# EAGLE design breakout_pico (EAGLE 9.6.2)
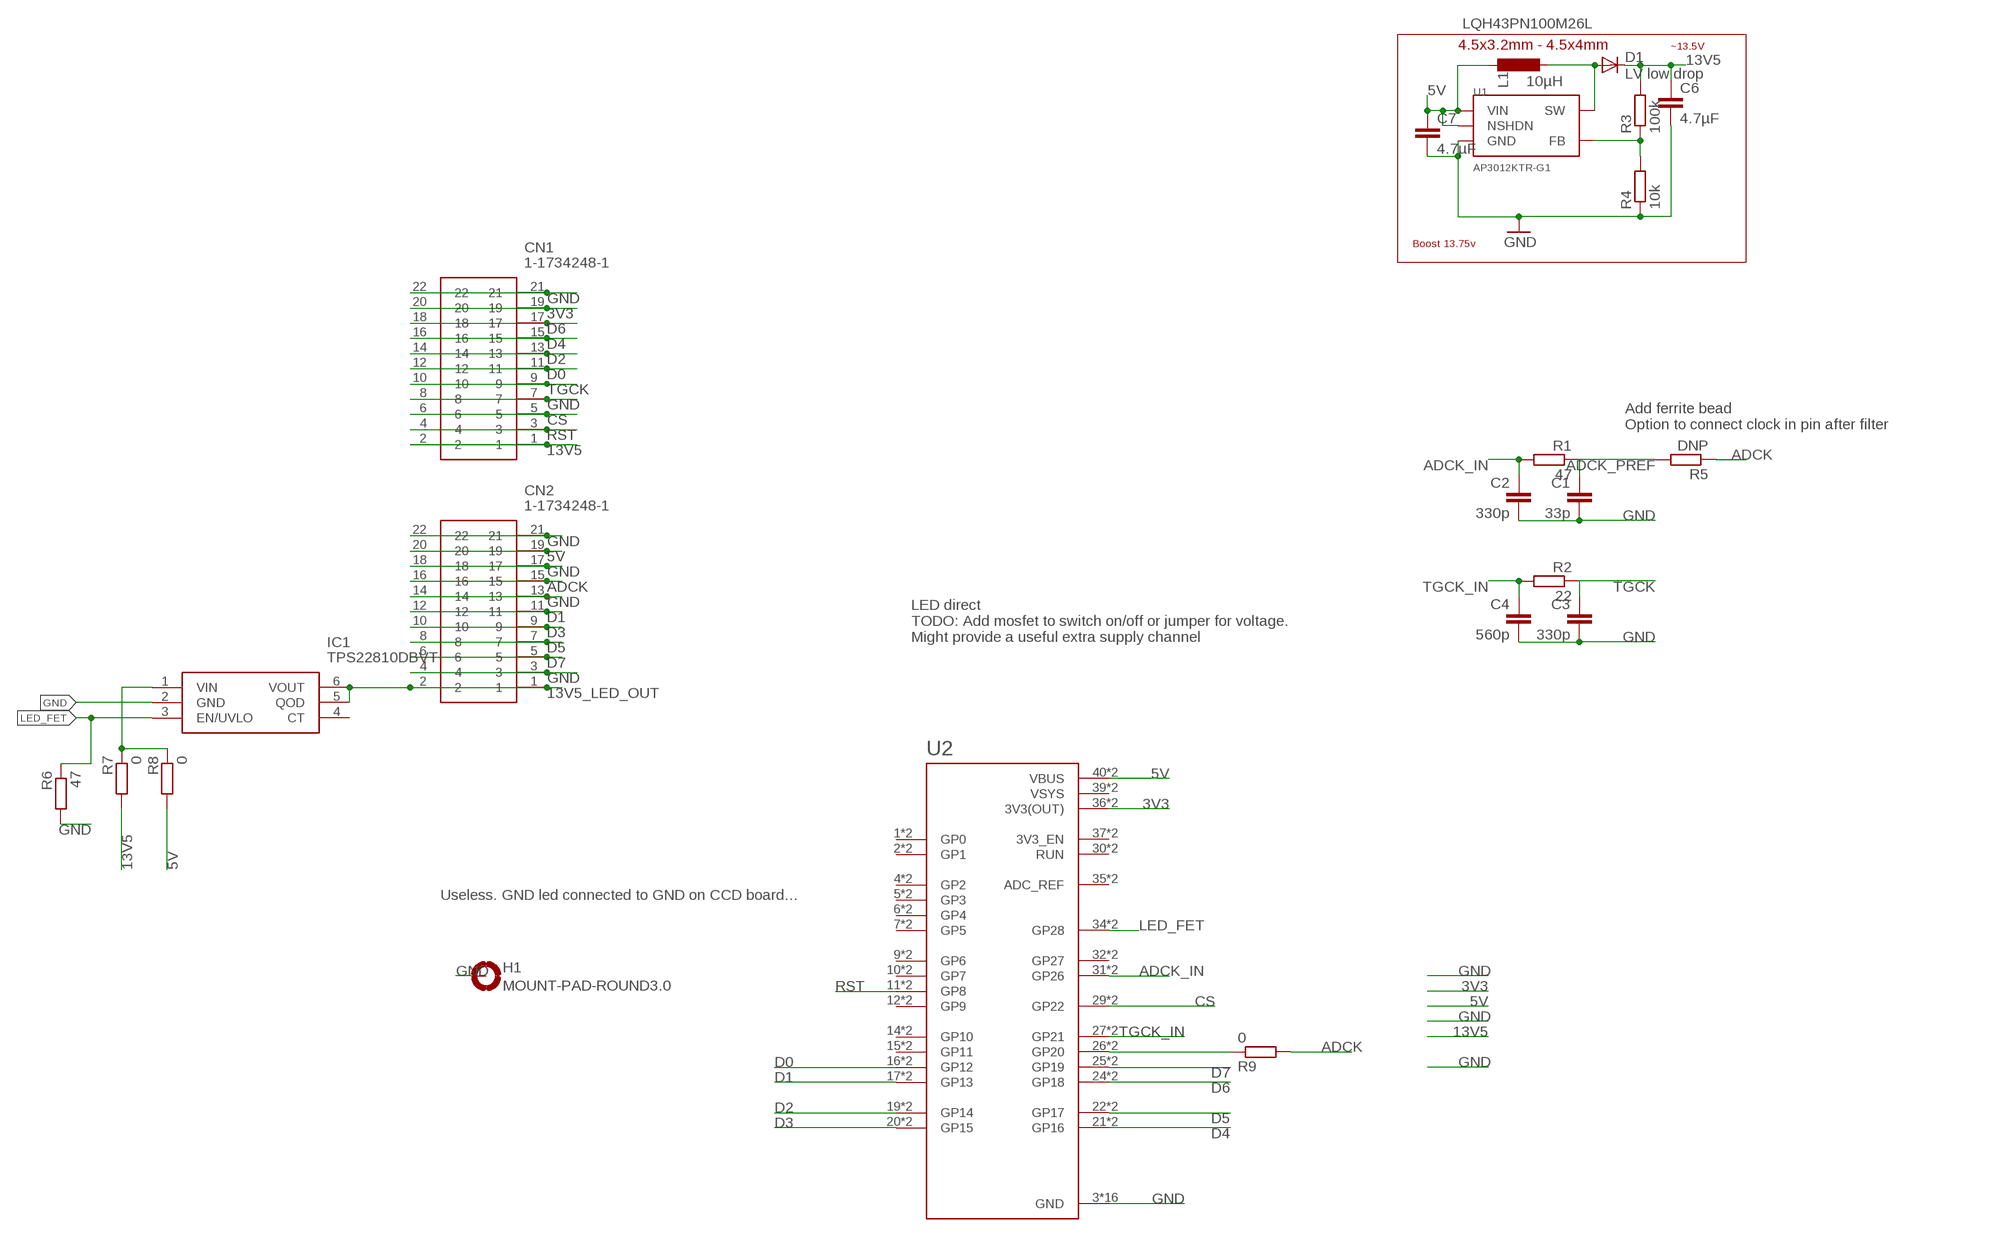
[diagram p0: schematic, sheet 1]

## Parts
C1  33p  C-EUC0603  [C0603]
C2  330p  C-EUC0603  [C0603]
C3  330p  C-EUC0603  [C0603]
C4  560p  C-EUC0603  [C0603]
C6  4.7µF  C-EUC0805  [C0805]
C7  4.7µF  C-EUC0805  [C0805]
CN1  1-1734248-1  [117342481]
CN2  1-1734248-1  [117342481]
D1  LV low drop  DIODE_SOD-123FL  [SOD-123FL]
H1  MOUNT-PAD-ROUND3.0  [3,0-PAD]
IC1  TPS22810DBVT  [SOT95P280X145-6N]
L1  10µH  L-EUL4532P  [L4532P]
R1  47  R-EU_R0603  [R0603]
R2  22  R-EU_R0603  [R0603]
R3  100k  R-EU_R0603  [R0603]
R4  10k  R-EU_R0603  [R0603]
R5  DNP  R-EU_R0603  [R0603]
R6  47  R-EU_R0603  [R0603]
R7  0  R-EU_R0603  [R0603]
R8  0  R-EU_R0603  [R0603]
R9  0  R-EU_R0603  [R0603]
U1  AP3012KTR-G1  [SOT23-5L]
U2  RASPBERRY_PICO-NO_DEBUG  [PICO-PKG-NO_DEBUG]

## Nets
3V3: CN1.19 CN1.20 U2.36(3V3(OUT)) U2.P$36(3V3(OUT))
5V: C7.1 CN2.19 CN2.20 L1.1 R8.2 U1.4(NSHDN) U1.5(VIN) U2.40(VBUS) U2.P$40(VBUS)
13V5: C6.1 CN1.1 CN1.2 D1.C R3.2 R7.2
13V5_LED_OUT: CN2.1 CN2.2 IC1.5(QOD) IC1.6(VOUT)
ADCK: CN2.15 CN2.16 R5.1 R9.2
ADCK_IN: C2.1 R1.2 U2.31(GP26) U2.P$31(GP26)
ADCK_PREF: C1.1 R1.1 R5.2
CS: CN1.5 CN1.6 U2.29(GP22) U2.P$29(GP22)
D0: CN1.11 CN1.12 U2.16(GP12) U2.P$16(GP12)
D1: CN2.11 CN2.12 U2.17(GP13) U2.P$17(GP13)
D2: CN1.13 CN1.14 U2.19(GP14) U2.P$19(GP14)
D3: CN2.9 CN2.10 U2.20(GP15) U2.P$20(GP15)
D4: CN1.15 CN1.16 U2.21(GP16) U2.P$21(GP16)
D5: CN2.7 CN2.8 U2.22(GP17) U2.P$22(GP17)
D6: CN1.17 CN1.18 U2.24(GP18) U2.P$24(GP18)
D7: CN2.5 CN2.6 U2.25(GP19) U2.P$25(GP19)
GND: C1.2 C2.2 C3.2 C4.2 C6.2 C7.2 CN1.7 CN1.8 CN1.21 CN1.22 CN2.3 CN2.4 CN2.13 CN2.14 CN2.17 CN2.18 CN2.21 CN2.22 H1.B3,0(MOUNT) IC1.2(GND) R4.1 R6.2 U1.2(GND) U2.3(GND) U2.8(GND) U2.13(GND) U2.18(GND) U2.23(GND) U2.28(GND) U2.33(GND) U2.38(GND) U2.P$3(GND) U2.P$8(GND) U2.P$13(GND) U2.P$18(GND) U2.P$23(GND) U2.P$28(GND) U2.P$33(GND) U2.P$38(GND)
LED_FET: IC1.3(EN/UVLO) R6.1 U2.34(GP28) U2.P$34(GP28)
N$1: R9.1 U2.26(GP20) U2.P$26(GP20)
N$2: R3.1 R4.2 U1.3(FB)
N$3: D1.A L1.2 U1.1(SW)
N$4: IC1.1(VIN) R7.1 R8.1
RST: CN1.3 CN1.4 U2.11(GP8) U2.P$11(GP8)
TGCK: C3.1 CN1.9 CN1.10 R2.1
TGCK_IN: C4.1 R2.2 U2.27(GP21) U2.P$27(GP21)
Unconnected: IC1.4(CT) U2.1(GP0) U2.2(GP1) U2.4(GP2) U2.5(GP3) U2.6(GP4) U2.7(GP5) U2.9(GP6) U2.10(GP7) U2.12(GP9) U2.14(GP10) U2.15(GP11) U2.30(RUN) U2.32(GP27) U2.35(ADC_REF) U2.37(3V3_EN) U2.P$1(GP0) U2.P$2(GP1) U2.P$4(GP2) U2.P$5(GP3) U2.P$6(GP4) U2.P$7(GP5) U2.P$9(GP6) U2.P$10(GP7) U2.P$12(GP9) U2.P$14(GP10) U2.P$15(GP11) U2.P$30(RUN) U2.P$32(GP27) U2.P$35(ADC_REF) U2.P$37(3V3_EN)

## Notes on the sheet
- LQH43PN100M26L
- 4.5x3.2mm - 4.5x4mm | ~13.5V
- Boost 13.75v
- Add ferrite bead
  Option to connect clock in pin after filter
- LED direct
  TODO: Add mosfet to switch on/off or jumper for voltage. 
  Might provide a useful extra supply channel
- Useless. GND led connected to GND on CCD board...

## Power pins joined to a net without a drawn wire
VSYS: U2.39(VSYS) U2.P$39(VSYS)

## Library data of the parts
C1-C4 C6 C7 = resistor:C-EU: CAPACITOR, European symbol
CN1 CN2 = SamacSys_Parts:1-1734248-1: Conn FPC Connector SKT 11 POS 1mm Solder ST SMD T/R/002 Source: Datasheet <https://www.te.com/commerce/DocumentDelivery/DDEController?Action=showdoc&DocId=Customer Drawing1734248E1pdfEnglishENG_CD_1734248_E1__.pdf1-1734248-0>; ARROW_PART_NUMBER: 1-1734248-1; ARROW_PRICE-STOCK: https://www.arrow.com/en/products/1-1734248-1/te-connectivity; DESCRIPTION: Conn FPC Connector SKT 11 POS 1mm Solder ST SMD T/R/002; HEIGHT: 8mm; MANUFACTURER_NAME: TE Connectivity; MANUFACTURER_PART_NUMBER: 1-1734248-1; MOUSER_PART_NUMBER: 571-1-1734248-1; MOUSER_PRICE-STOCK: https://www.mouser.co.uk/ProductDetail/TE-Connectivity-AMP/1-1734248-1?qs=GQ3BsEl46pmEIHtCZ8sBMw%3D%3D
D1 = adafruit:DIODE: Diode SMADIODE - SMA Surface Mount Package 20V 1A Schottky Diode Digikey: 641-1014-6-ND DO-1N4148 - Through Hole Small Current Diode SOD-123 20V 1 A (.5mV Vf) Schottky Diode - Digikey: MBRX120TPMSCT-ND SOD-323 10V 570mA (.38mV Vf, 3ns) Schottky Diode - Digikey: ZLLS410CT-ND SOD-523 30V 30mA Schottky Diode (RB751S-40TE61) - Digikey: RB751S-40TE61CT-ND SOT23-R/W - SOT23 Package (R = Solder Paste/Reflow Ovens, W = Hand-Soldering) BAT54Film 40V 300mA - Digikey: 497-7162-1-ND
H1 = holes:MOUNT-PAD-ROUND: MOUNTING PAD, round
IC1 = SamacSys_Parts:TPS22810DBVT: 18V, 3A, 79m load switch with adjustable rise time, adj. quick output discharge, & thermal shutdown Source: Datasheet <http://www.ti.com/lit/gpn/TPS22810>; ARROW_PART_NUMBER: TPS22810DBVT; ARROW_PRICE-STOCK: https://www.arrow.com/en/products/tps22810dbvt/texas-instruments?utm_currency=USD&region=nac; DESCRIPTION: 18V, 3A, 79m load switch with adjustable rise time, adj. quick output discharge, & thermal shutdown; HEIGHT: 1.45mm; MANUFACTURER_NAME: Texas Instruments; MANUFACTURER_PART_NUMBER: TPS22810DBVT; MOUSER_PART_NUMBER: 595-TPS22810DBVT; MOUSER_PRICE-STOCK: https://www.mouser.co.uk/ProductDetail/Texas-Instruments/TPS22810DBVT?qs=34RfhUjJmKcpY51nBe7C4Q%3D%3D
L1 = rcl:L-EU: INDUCTOR, European symbol; SPICEPREFIX: L
R1-R9 = resistor:R-EU_: RESISTOR, European symbol
U1 = Powermisc:AP3012KTR-G1
U2 = RpiPico:RASPBERRY_PICO-NO_DEBUG

## Board
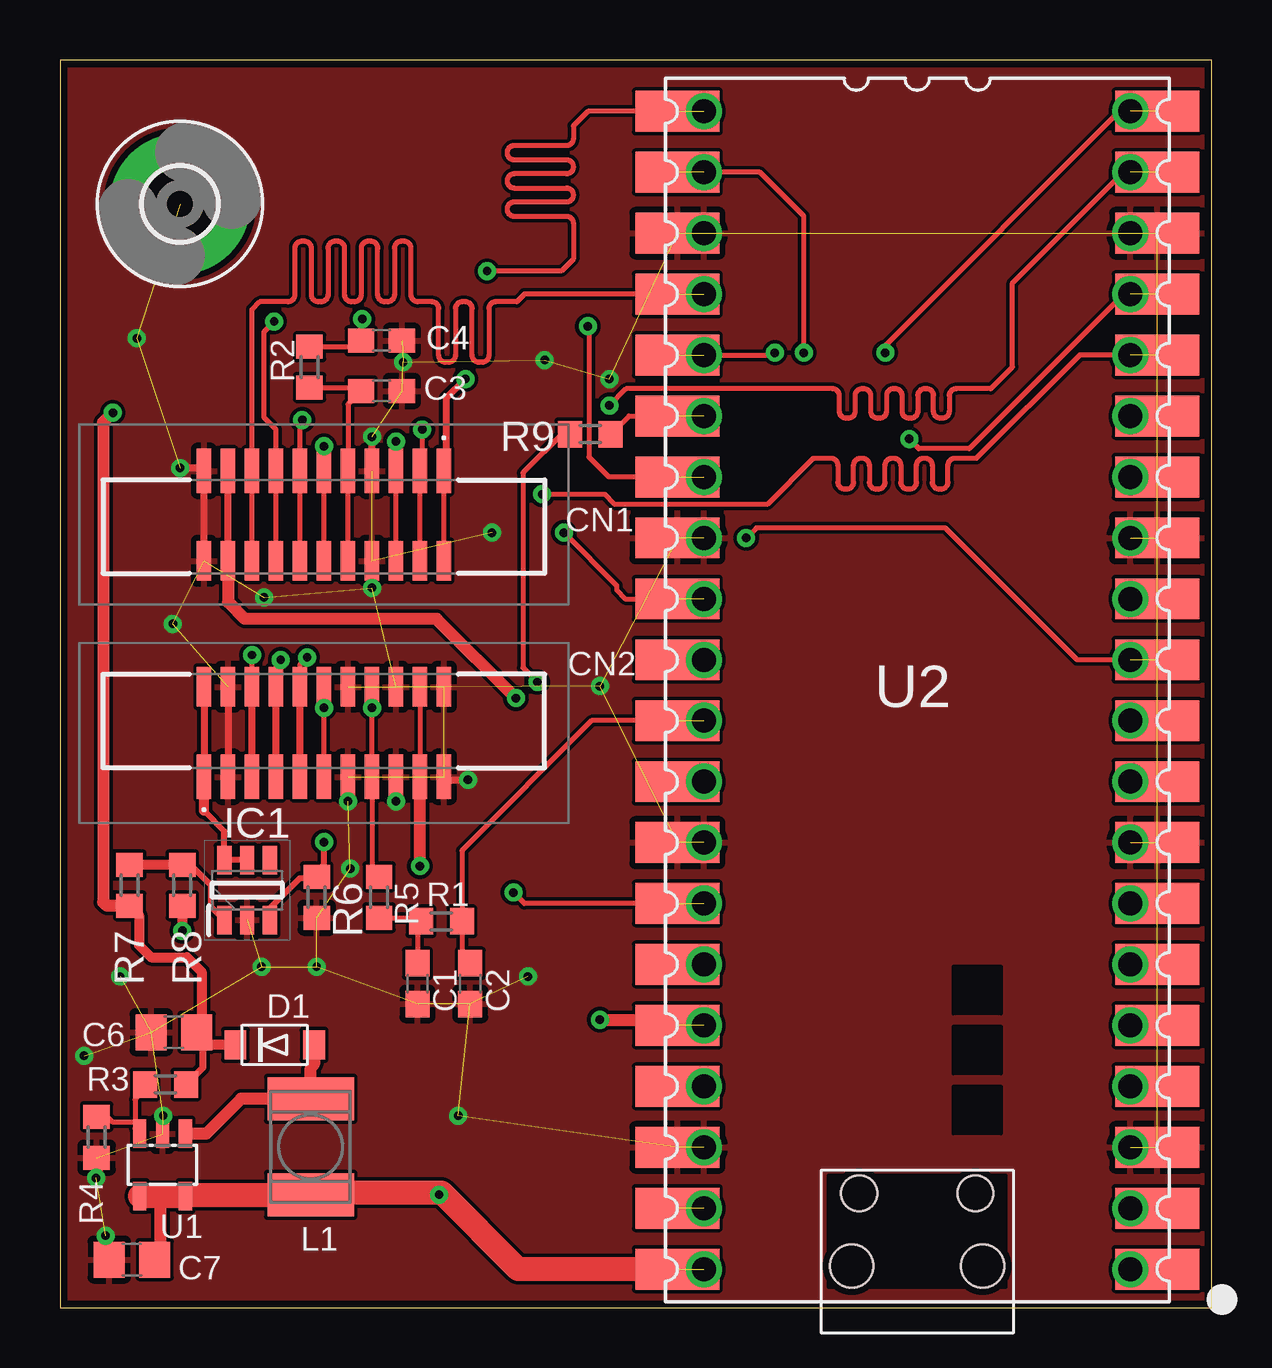
[diagram p1: board, top side]
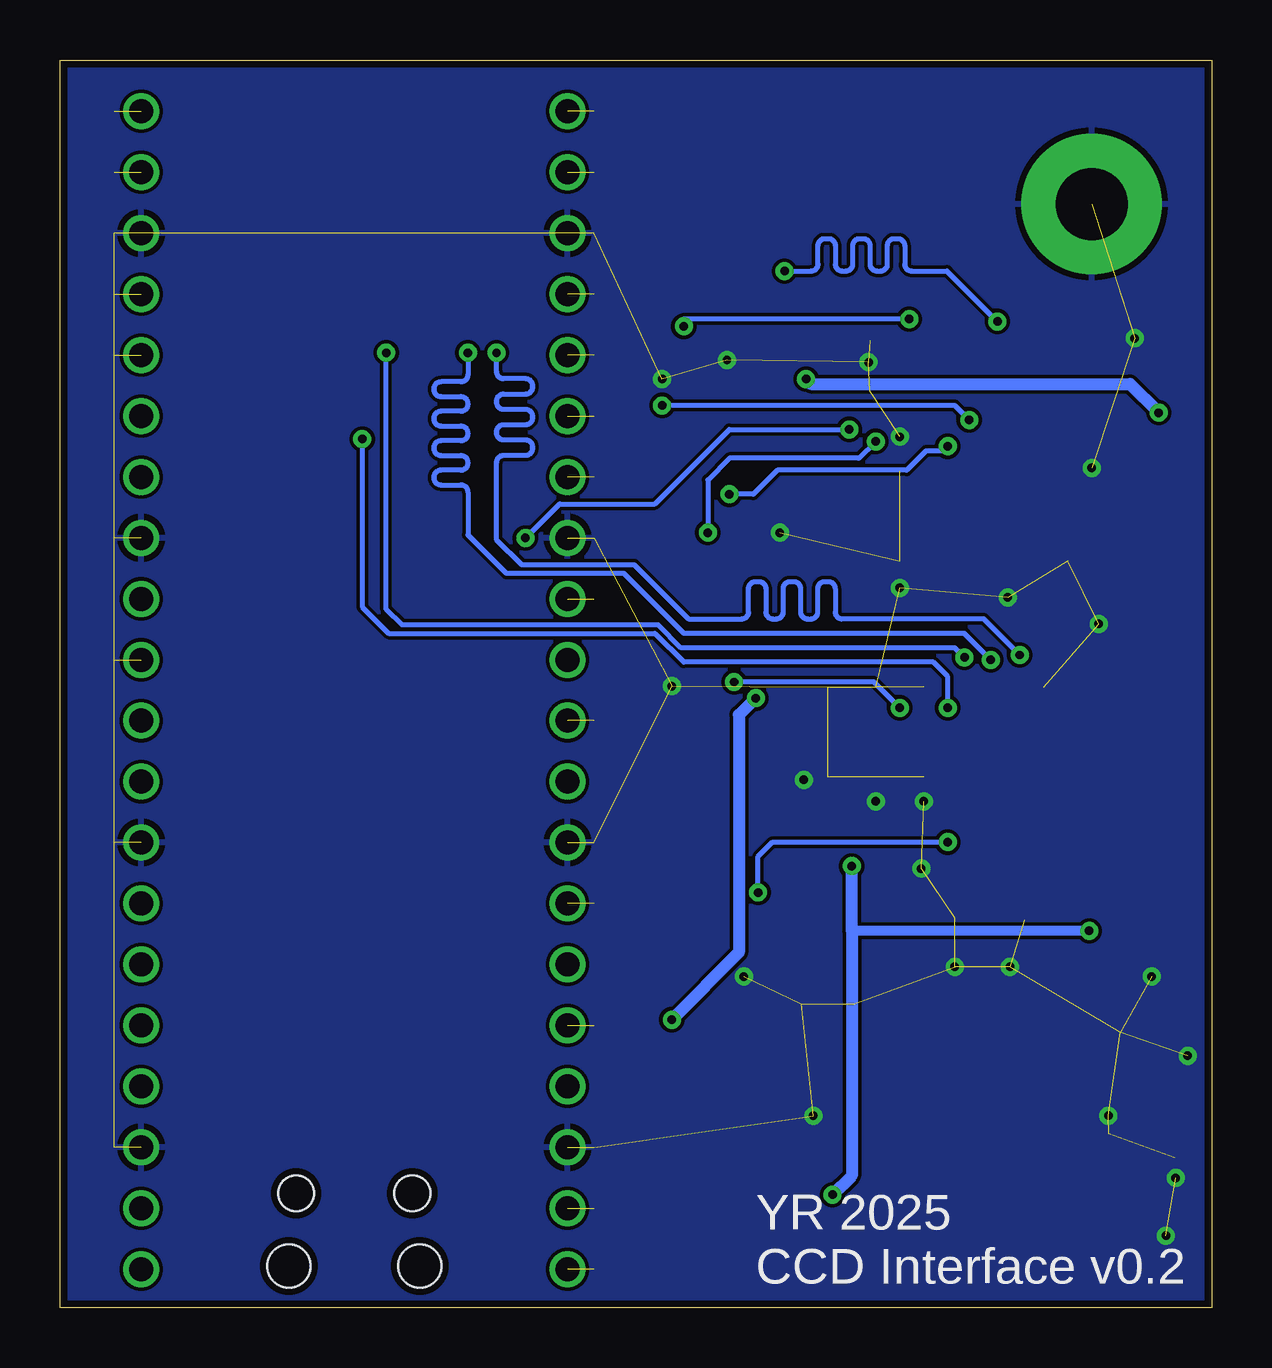
[diagram p2: board, bottom side, seen from below]

Size 48 x 52 mm. Coordinates in mm from the lower left corner, seen from the top.
Outline: 0,0 48,0 48,52 0,52 0,0
Copper layers (1*16): Top 0.035mm / dielectric 1.5mm / Bottom 0.035mm
Design rules "aisler_2_layer_simple *": minimum track width 0.2mm, minimum drill 0.3mm, track to track 0.15mm, track to pad 0.15mm, pad to pad 0.15mm, via to via 0.15mm, smd to smd 0mil, copper to edge 0.3mm, drill to drill 0.3mm, minimum pad ring 0.2mm, minimum via ring 0.2mm, stop-mask expansion 0mil, vias tented up to drill 0.5mm, thermal gap 10mil

### Footprints (pad centres in the part's own frame; a part is rotated, then mirrored left to right if it is on the bottom)
C0603 = smd 1.1 x 1: 1 -0.85,0; 2 0.85,0
C0805 = smd 1.3 x 1.5: 1 -0.95,0; 2 0.95,0
117342481 = smd 0.6 x 1.85: 1 5,1.875; 3 4,1.875; 5 3,1.875; 7 2,1.875; 9 1,1.875; 11 0,1.875; 13 -1,1.875; 15 -2,1.875; 17 -3,1.875; 19 -4,1.875; 21 -5,1.875 | smd 0.6 x 1.65: 2 5,-1.875; 4 4,-1.875; 6 3,-1.875; 8 2,-1.875; 10 1,-1.875; 12 0,-1.875; 14 -1,-1.875; 16 -2,-1.875; 18 -3,-1.875; 20 -4,-1.875; 22 -5,-1.875
SOD-123FL = smd 0.91 x 1.22: A 1.637,0; C -1.637,0
3,0-PAD = drill 3 pad 5.842: B3,0 0,0
SOT95P280X145-6N = smd 1.2 x 0.6: 1 -1.25,0.95; 2 -1.25,0; 3 -1.25,-0.95; 4 1.25,-0.95; 5 1.25,0; 6 1.25,0.95
L4532P = smd 1.8 x 3.6: 1 -2,0; 2 2,0
R0603 = smd 1 x 1.1: 1 -0.85,0; 2 0.85,0
SOT23-5L = smd 0.55 x 1.2: 1 -0.95,-1.3; 2 0,-1.3; 3 0.95,-1.3; 4 0.95,1.3; 5 -0.95,1.3
PICO-PKG-NO_DEBUG = drill 1: 1 -7.62,25.4; 2 -7.62,22.86; 3 -7.62,20.32; 4 -7.62,17.78; 5 -7.62,15.24; 6 -7.62,12.7; 7 -7.62,10.16; 8 -7.62,7.62; 9 -7.62,5.08; 10 -7.62,2.54; 11 -7.62,0; 12 -7.62,-2.54; 13 -7.62,-5.08; 14 -7.62,-7.62; 15 -7.62,-10.16; 16 -7.62,-12.7; 17 -7.62,-15.24; 18 -7.62,-17.78; 19 -7.62,-20.32; 20 -7.62,-22.86; 21 10.16,-22.86; 22 10.16,-20.32; 23 10.16,-17.78; 24 10.16,-15.24; 25 10.16,-12.7; 26 10.16,-10.16; 27 10.16,-7.62; 28 10.16,-5.08; 29 10.16,-2.54; 30 10.16,0; 31 10.16,2.54; 32 10.16,5.08; 33 10.16,7.62; 34 10.16,10.16; 35 10.16,12.7; 36 10.16,15.24; 37 10.16,17.78; 38 10.16,20.32; 39 10.16,22.86; 40 10.16,25.4 | smd 3.5 x 1.7: P$1 -8.73,25.4; P$2 -8.73,22.86; P$3 -8.73,20.32; P$4 -8.73,17.78; P$5 -8.73,15.24; P$6 -8.73,12.7; P$7 -8.73,10.16; P$8 -8.73,7.62; P$9 -8.73,5.08; P$10 -8.73,2.54; P$11 -8.73,0; P$12 -8.73,-2.54; P$13 -8.73,-5.08; P$14 -8.73,-7.62; P$15 -8.73,-10.16; P$16 -8.73,-12.7; P$17 -8.73,-15.24; P$18 -8.73,-17.78; P$19 -8.73,-20.32; P$20 -8.73,-22.86; P$21 11.27,-22.86; P$22 11.27,-20.32; P$23 11.27,-17.78; P$24 11.27,-15.24; P$25 11.27,-12.7; P$26 11.27,-10.16; P$27 11.27,-7.62; P$28 11.27,-5.08; P$29 11.27,-2.54; P$30 11.27,0; P$31 11.27,2.54; P$32 11.27,5.08; P$33 11.27,7.62; P$34 11.27,10.16; P$35 11.27,12.7; P$36 11.27,15.24; P$37 11.27,17.78; P$38 11.27,20.32; P$39 11.27,22.86; P$40 11.27,25.4 | hole 1.8: -1.455,25.27; 3.995,25.27 | hole 1.5: -1.155,22.24; 3.695,22.24

### Placement (x,y rotation side)
C1  14.9,13.5 270 top
C2  17.1,13.5 270 top
C3  13.4,38.2 0 top
C4  13.4,40.3 0 top
C6  4.75,11.47 180 top
C7  3,2 180 top
CN1  11,33 0 top
CN2  11,24 180 top
D1  8.95,10.95 0 top
H1  5,46 0 top
IC1  7.8,17.4 90 top
L1  10.45,6.7 90 top
R1  15.9,16.1 0 top
R2  10.4,39.2 90 top
R3  4.4,9.3 0 top
R4  1.52,7.1 90 top
R5  13.3,17.1 270 top
R6  10.7,17.1 270 top
R7  2.9,17.6 270 top
R8  5.1,17.6 270 top
R9  22.1,36.4 180 top
U1  4.28,5.95 180 top
U2  37,27 180 top

### Tracks (layer width: path | path; a pad name or v marks a point on that pad's centre or on a via)
3V3  (via drill 0.35)  (1 unrouted)
  Top 0.3: CN1.20 CN1.19
  Top 0.5: CN1.20 7,29.4 7.7,28.7 15.7,28.7 v19,25.4 | v22.5,12 26.6,12 U2.36
  Bottom 0.5: v19,25.4 19.7,24.7 19.7,14.8 v22.5,12
5V  (via drill 0.35)  (1 unrouted)
  Top 0.2: U1.5 5.28,4.7 | CN2.20 CN2.19
  Top 0.406: R8.2 v5.1,15.7
  Top 0.5: 15.9,4.8 v15.8,4.7 | v15,18.4 CN2.19 | C7.1 4.2,2.25 4.2,4.65
  Top 1: U1.4 4.2,4.65 U1.5 | 5.28,4.7 L1.1 10.55,4.8 15.9,4.8 19.1,1.6 U2.P$40
  Bottom 0.406: v5.1,15.7 15,15.7
  Bottom 0.5: v15.8,4.7 15,5.5 15,15.7 v15,18.4
13V5  (via drill 0.35)
  Top 0.2: CN1.2 CN1.1
  Top 0.3: CN1.1 16.1,34.98 16.1,37.9 v16.9,38.7 | R3.2 5.95,10 5.95,10.95 D1.C
  Top 0.406: R7.2 3.3,16.35 3.3,15.1 3.8,14.6 5.3,14.6 5.9,14 5.9,11.47 | C6.1 6.22,10.95 D1.C
  Top 0.5: 5.9,11.47 C6.1 | v2.2,37.3 1.8,36.9 1.8,16.9 1.95,16.75 R7.2
  Bottom 0.5: v2.2,37.3 3.4,38.5 16.7,38.5 v16.9,38.7
13V5_LED_OUT
  Top 0.254: IC1.5 IC1.6 6.85,19.85 6,20.7
  Top 0.3: CN2.2 CN2.1
  Top 0.406: 6,20.7 CN2.1
ADCK  (via drill 0.35)
  Top 0.2: 13.25,17.95 R5.1 13,18.25 CN2.15 v13,25 | 21.3,36.8 21,36.5 | 21,36.5 19.3,34.8 19.3,26.68 v19.9,26.07 | R9.2 21.15,36.5 21,36.5
  Top 0.3: v13,25 CN2.16
  Bottom 0.2: v13,25 14.07,26.07 v19.9,26.07
ADCK_IN  (1 unrouted)
  Top 0.2: C2.1 16.8,14.35 16.75,14.4 R1.2 16.75,19.05 22.16,24.46 U2.P$31
ADCK_PREF
  Top 0.2: C1.1 14.9,15.95 R1.1 14.9,16.25 R5.2
CS  (via drill 0.35)  (1 unrouted)
  Top 0.2: v14,36.1 14,35 | v21,32.3 23.2,30.1 23.2,29.9 23.56,29.54 U2.29 | CN1.6 CN1.5
  Top 0.3: CN1.5 14,35
  Bottom 0.2: v14,36.1 14.7,35.4 20.1,35.4 21,34.5 v21,32.3
D0  (via drill 0.35)  (1 unrouted)
  Top 0.2: U2.P$16 42.5,39.7 38.2,35.4 37.3,35.4 arc90 37.01,35.11 37.01,34.4 arc-90 36.73,34.12 36.65,34.12 arc-90 36.36,34.4 36.36,35.11 arc90 36.07,35.4 35.99,35.4 arc90 35.7,35.11 35.7,34.4 arc-90 35.41,34.12 35.33,34.12 arc-90 35.05,34.4 35.05,35.11 arc90 34.76,35.4 34.68,35.4 arc90 34.39,35.11 34.39,34.4 arc-90 34.1,34.12 34.02,34.12 arc-90 33.73,34.4 33.73,35.11 arc90 33.45,35.4 33.37,35.4 arc90 33.08,35.11 33.08,34.4 arc-90 32.79,34.12 32.71,34.12 arc-90 32.42,34.4 32.42,35.11 arc90 32.14,35.4 31.4,35.4 29.5,33.5 23.1,33.5 22.7,33.9 v20.1,33.9 | CN1.12 11,35 | CN1.11 v11,35.9
  Top 0.3: 11,35 CN1.11
  Bottom 0.2: v20.1,33.9 19.1,33.9 18.1,34.9 12.7,34.9 11.9,35.7 11.2,35.7 v11,35.9
D1  (via drill 0.35)  (1 unrouted)
  Top 0.2: U2.P$17 44.34,42.24 37.9,35.8 35.8,35.8 v35.4,36.2 | CN2.11 v11,25
  Top 0.3: CN2.12 v11,25
  Bottom 0.2: v11,25 11,26.3 11.6,26.9 22,26.9 23.2,28.1 34.3,28.1 35.4,29.2 v35.4,36.2
D2  (via drill 0.35)  (1 unrouted)
  Top 0.2: U2.P$19 44.32,47.32 39.7,42.7 39.7,39.2 38.8,38.3 37.35,38.3 arc90 37.07,38.01 37.07,37.36 arc-90 36.78,37.07 36.7,37.07 arc-90 36.41,37.36 36.41,38.01 arc90 36.12,38.3 36.05,38.3 arc90 35.76,38.01 35.76,37.36 arc-90 35.47,37.07 35.39,37.07 arc-90 35.1,37.36 35.1,38.01 arc90 34.82,38.3 34.74,38.3 arc90 34.45,38.01 34.45,37.36 arc-90 34.16,37.07 34.08,37.07 arc-90 33.8,37.36 33.8,38.01 arc90 33.51,38.3 33.43,38.3 arc90 33.14,38.01 33.14,37.36 arc-90 32.85,37.07 32.77,37.07 arc-90 32.49,37.36 32.49,38.01 arc90 32.2,38.3 23.6,38.3 v22.9,37.6 | v10.1,37 10,36.9 CN1.13 CN1.14
  Bottom 0.2: v10.1,37 10.7,37.6 v22.9,37.6
D3  (via drill 0.35)  (1 unrouted)
  Top 0.2: U2.P$20 44.16,49.86 34.4,40.1 v34.4,39.8 | CN2.10 10,26.8 v10.3,27.1
  Top 0.3: CN2.9 CN2.10
  Bottom 0.2: v34.4,39.8 34.4,29.1 33.75,28.45 23.05,28.45 22.11,27.5 10.7,27.5 v10.3,27.1
D4  (via drill 0.35)  (1 unrouted)
  Top 0.2: U2.P$21 22,49.86 21.4,49.26 21.4,48.72 arc-90 21.11,48.43 18.93,48.43 arc90 18.64,48.14 18.64,48.13 arc90 18.93,47.84 21.11,47.84 arc-90 21.4,47.55 21.4,47.54 arc-90 21.11,47.25 18.93,47.25 arc90 18.64,46.97 18.64,46.95 arc90 18.93,46.66 21.11,46.66 arc-90 21.4,46.38 21.4,46.36 arc-90 21.11,46.08 18.93,46.08 arc90 18.64,45.79 18.64,45.77 arc90 18.93,45.49 21.11,45.49 arc-90 21.4,45.2 21.4,43.7 20.9,43.2 v17.8,43.2 | CN1.16 CN1.15 9,36.6 8.5,37.1 8.5,40.67 v8.93,41.1
  Bottom 0.2: v17.8,43.2 16.69,43.2 arc-90 16.4,43.49 16.4,44.26 arc90 16.11,44.55 15.97,44.55 arc90 15.68,44.26 15.68,43.49 arc-90 15.39,43.2 15.24,43.2 arc-90 14.96,43.49 14.96,44.26 arc90 14.67,44.55 14.52,44.55 arc90 14.23,44.26 14.23,43.49 arc-90 13.95,43.2 13.8,43.2 arc-90 13.51,43.49 13.51,44.26 arc90 13.22,44.55 13.07,44.55 arc90 12.79,44.26 12.79,43.49 arc-90 12.5,43.2 11.03,43.2 v8.93,41.1
D5  (via drill 0.35)  (1 unrouted)
  Top 0.2: CN2.8 9,26.8 v9.2,27 | v31,39.8 31,45.5 29.18,47.32 U2.22
  Top 0.3: CN2.7 CN2.8
  Bottom 0.2: v9.2,27 10.3,28.1 22,28.1 24.5,30.6 29.39,30.6 31,32.2 31,34 arc-90 31.29,34.29 32.12,34.29 arc90 32.41,34.58 32.41,34.61 arc90 32.12,34.9 31.29,34.9 arc-90 31,35.19 31,35.23 arc-90 31.29,35.52 32.12,35.52 arc90 32.41,35.8 32.41,35.84 arc90 32.12,36.13 31.29,36.13 arc-90 31,36.42 31,36.45 arc-90 31.29,36.74 32.12,36.74 arc90 32.41,37.03 32.41,37.07 arc90 32.12,37.36 31.29,37.36 arc-90 31,37.64 31,37.68 arc-90 31.29,37.97 32.12,37.97 arc90 32.41,38.26 32.41,38.3 arc90 32.12,38.58 31.29,38.58 arc-90 31,38.87 v31,39.8
D6  (1 unrouted)
  Top 0.2: U2.P$24 19.36,42.24 19.05,41.92 18.17,41.92 arc90 17.88,41.64 17.88,39.69 arc-90 17.59,39.4 17.47,39.4 arc-90 17.18,39.69 17.18,41.64 arc90 16.89,41.92 16.77,41.92 arc90 16.48,41.64 16.48,39.69 arc-90 16.2,39.4 16.07,39.4 arc-90 15.79,39.69 15.79,41.64 arc90 15.5,41.92 14.92,41.92 arc-90 14.63,42.21 14.63,44.16 arc90 14.35,44.44 14.23,44.44 arc90 13.94,44.16 13.94,42.21 arc-90 13.65,41.92 13.54,41.92 arc-90 13.25,42.21 13.25,44.16 arc90 12.96,44.44 12.84,44.44 arc90 12.56,44.16 12.56,42.21 arc-90 12.27,41.92 12.15,41.92 arc-90 11.86,42.21 11.86,44.16 arc90 11.58,44.44 11.46,44.44 arc90 11.17,44.16 11.17,42.21 arc-90 10.88,41.92 10.77,41.92 arc-90 10.48,42.21 10.48,44.16 arc90 10.19,44.44 10.07,44.44 arc90 9.79,44.16 9.79,42.21 arc-90 9.5,41.92 8.32,41.92 8,41.6 CN1.17 CN1.18
D7  (via drill 0.35)  (1 unrouted)
  Top 0.2: U2.P$25 29.7,39.7 v29.8,39.8 | CN2.6 v8,27.2
  Top 0.3: CN2.5 CN2.6
  Bottom 0.2: v29.8,39.8 29.8,39 arc-90 29.51,38.71 28.59,38.71 arc90 28.3,38.42 28.3,38.36 arc90 28.59,38.07 29.51,38.07 arc-90 29.8,37.79 29.8,37.72 arc-90 29.51,37.44 28.59,37.44 arc90 28.3,37.15 28.3,37.09 arc90 28.59,36.8 29.51,36.8 arc-90 29.8,36.51 29.8,36.45 arc-90 29.51,36.16 28.59,36.16 arc90 28.3,35.87 28.3,35.81 arc90 28.59,35.52 29.51,35.52 arc-90 29.8,35.23 29.8,32 28.75,30.95 24.05,30.95 21.8,28.7 19.58,28.7 arc-90 19.3,28.99 19.3,29.97 arc90 19.01,30.26 18.86,30.26 arc90 18.57,29.97 18.57,28.99 arc-90 18.29,28.7 18.14,28.7 arc-90 17.85,28.99 17.85,29.97 arc90 17.57,30.26 17.42,30.26 arc90 17.13,29.97 17.13,28.99 arc-90 16.84,28.7 16.7,28.7 arc-90 16.41,28.99 16.41,29.97 arc90 16.12,30.26 15.97,30.26 arc90 15.69,29.97 15.69,28.99 arc-90 15.4,28.7 9.5,28.7 v8,27.2
GND  (via drill 0.35)  (52 unrouted)
  Top 0.3: CN2.21 16.12,22 v17,22 | v5,35 5.88,35 CN1.21 CN1.22 | CN1.7 v13,36.3 | CN1.8 v13,30 | CN2.4 CN2.3
  Top 0.5: CN2.17 v14,21.1 | CN2.13 v12,21.1 | C7.2 1.9,2.15 v1.9,3 | R4.1 1.52,5.42 v1.5,5.4
  other vias: 19.5,13.8 12.1,18.3 2.5,13.8 4.3,8 4.7,28.5 22.9,38.7 3.2,40.4 22.5,25.9 18,32.3 16.6,8 14.3,39.4 20.2,39.5 10.7,14.2 8.4,14.2 1,10.5 8.5,29.6
  pour Top: -1,0 -1,52 48,52 48,0
  pour Bottom: -2,0 -2,52 48,52 48,0
LED_FET  (via drill 0.35)  (1 unrouted)
  Top 0.2: U2.P$34 19.36,16.84 v18.9,17.3
  Top 0.254: IC1.3 8.75,16.65 10,17.9 10.8,17.9 10.75,17.95 R6.1 10.7,18.2 11,18.5 v11,19.4
  Bottom 0.2: v18.9,17.3 18.9,18.8 18.3,19.4 v11,19.4
N$1  (1 unrouted)
  Top 0.2: R9.1 23.71,37.16 U2.26
N$2
  Top 0.2: R4.2 1.98,7.95 2.17,7.75 3.12,7.75 3.33,7.55 U1.3 3.12,7.45 3.12,8.66 3.55,9.18 R3.1
N$3
  Top 0.5: D1.A 10.59,10.14 10.45,10 L1.2 7.55,8.7 6.1,7.25 U1.1
N$4
  Top 0.254: IC1.1 6.3,16.7 6.3,17.6 5.45,18.45 R8.1
  Top 0.406: R8.1 R7.1
RST  (via drill 0.35)  (1 unrouted)
  Top 0.2: v15.1,36.6 15.1,34.98 CN1.3 CN1.4 | U2.P$11 42.4,27 36.9,32.5 29.02,32.5 v28.6,32.08
  Bottom 0.2: v15.1,36.6 20.1,36.6 23.2,33.5 27.18,33.5 v28.6,32.08
TGCK
  Top 0.2: R2.1 12.4,38.35 C3.1 12,37.65 CN1.9 CN1.10
TGCK_IN  (via drill 0.35)  (1 unrouted)
  Top 0.2: R2.2 12.3,40.05 C4.1 12.55,41.15 v12.6,41.2 | U2.P$27 22.88,34.62 22.05,35.45 22.05,40.85 v22,40.9
  Bottom 0.2: v12.6,41.2 22,41.2 v22,40.9
VSYS  (1 unrouted)

### Text on the board
bPlace: YR 2025 / CCD Interface v0.2